# Altium schematic sheet BConditioner.SchDoc
size A4; SheetNumber: 4; SheetTotal: 5
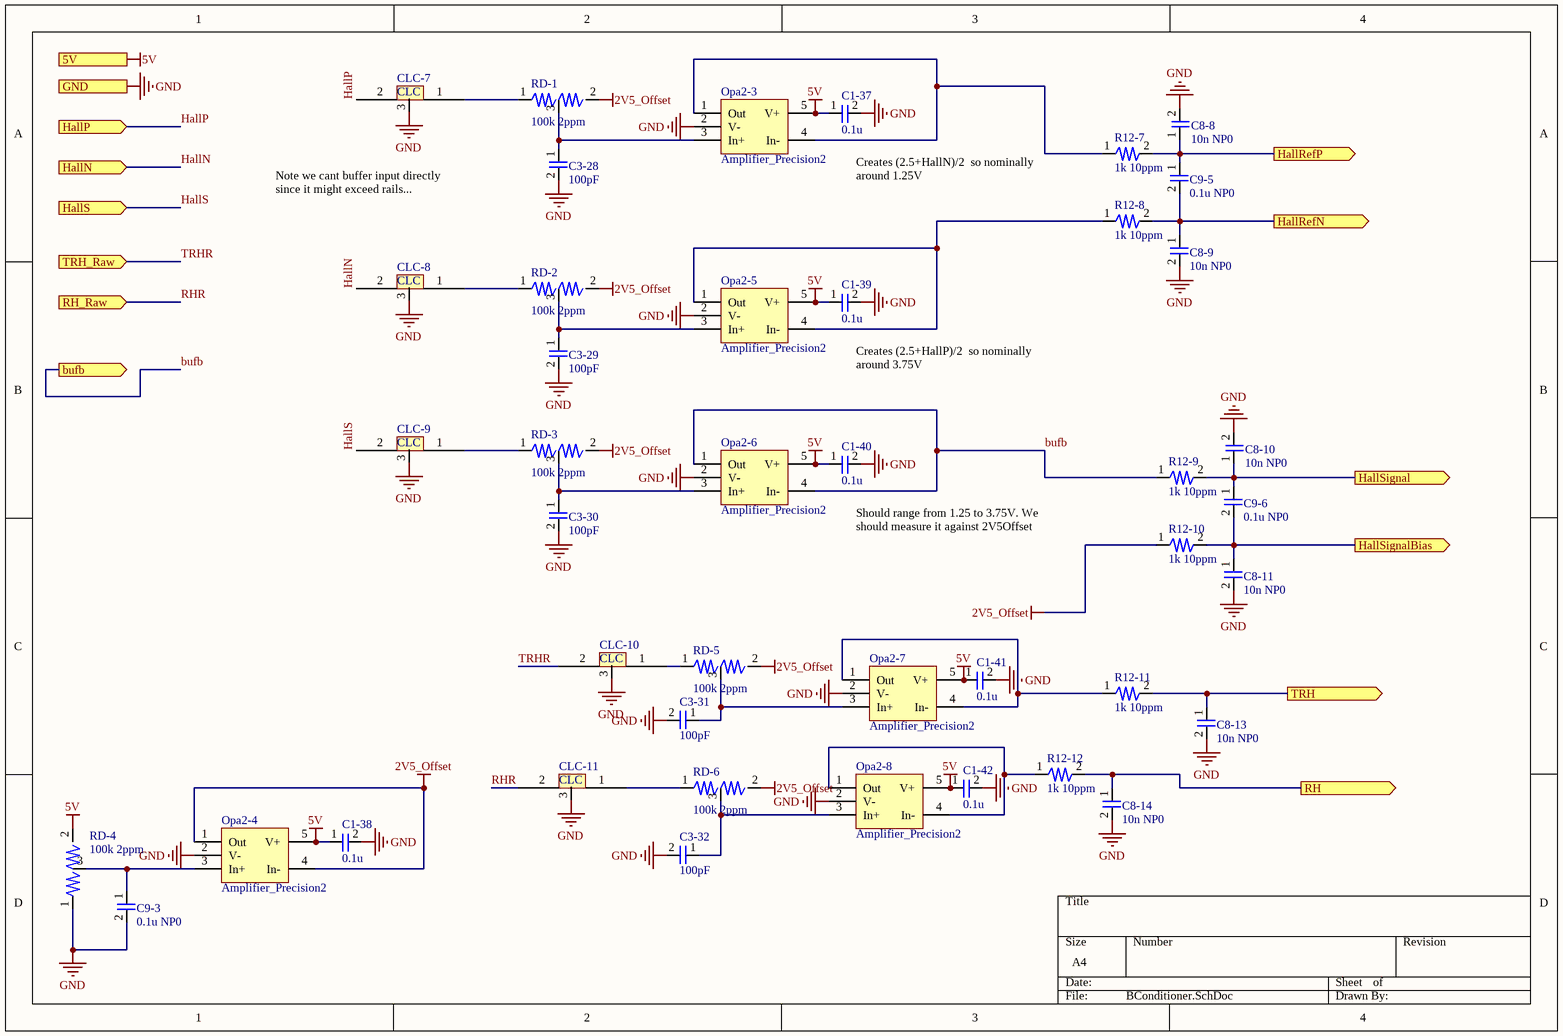
[diagram p0: BConditioner.SchDoc]

## Parts
C1-37  0.1u  [0805]
C1-38  0.1u  [0805]
C1-39  0.1u  [0805]
C1-40  0.1u  [0805]
C1-41  0.1u  [0805]
C1-42  0.1u  [0805]
C3-28  100pF  [0402]
C3-29  100pF  [0402]
C3-30  100pF  [0402]
C3-31  100pF  [0402]
C3-32  100pF  [0402]
C8-8  10n NP0  [0805]
C8-9  10n NP0  [0805]
C8-10  10n NP0  [0805]
C8-11  10n NP0  [0805]
C8-13  10n NP0  [0805]
C8-14  10n NP0  [0805]
C9-3  0.1u NP0  [1206]
C9-5  0.1u NP0  [1206]
C9-6  0.1u NP0  [1206]
CLC-7  CLC_Filter  [CRCFilter]  (value not drawn)
CLC-8  CLC_Filter  [CRCFilter]  (value not drawn)
CLC-9  CLC_Filter  [CRCFilter]  (value not drawn)
CLC-10  CLC_Filter  [CRCFilter]  (value not drawn)
CLC-11  CLC_Filter  [CRCFilter]  (value not drawn)
Opa2-3  Amplifier_Precision2  [SOT23-5]
Opa2-4  Amplifier_Precision2  [SOT23-5]
Opa2-5  Amplifier_Precision2  [SOT23-5]
Opa2-6  Amplifier_Precision2  [SOT23-5]
Opa2-7  Amplifier_Precision2  [SOT23-5]
Opa2-8  Amplifier_Precision2  [SOT23-5]
R12-7  1k 10ppm  [0805]
R12-8  1k 10ppm  [0805]
R12-9  1k 10ppm  [0805]
R12-10  1k 10ppm  [0805]
R12-11  1k 10ppm  [0805]
R12-12  1k 10ppm  [0805]
RD-1  100k 2ppm  [SOT23-3]
RD-2  100k 2ppm  [SOT23-3]
RD-3  100k 2ppm  [SOT23-3]
RD-4  100k 2ppm  [SOT23-3]
RD-5  100k 2ppm  [SOT23-3]
RD-6  100k 2ppm  [SOT23-3]

## Ports
5V (in), bufb (out), GND (in), HallN (in), HallP (in), HallRefN (out), HallRefP (out), HallS (in), HallSignal (out), HallSignalBias (out), RH (out), RH_Raw (in), TRH (out), TRH_Raw (in)

## Nets
2V5_Offset: Opa2-4.1(Out) Opa2-4.4(In-) R12-10.1 RD-1.2 RD-2.2 RD-3.2 RD-5.2 RD-6.2
5V: C1-37.1 C1-38.1 C1-39.1 C1-40.1 C1-41.1 C1-42.1 Opa2-3.5(V+) Opa2-4.5(V+) Opa2-5.5(V+) Opa2-6.5(V+) Opa2-7.5(V+) Opa2-8.5(V+) RD-4.2 ; port 5V
GND: C1-37.2 C1-38.2 C1-39.2 C1-40.2 C1-41.2 C1-42.2 C3-28.2 C3-29.2 C3-30.2 C3-31.2 C3-32.2 C8-8.2 C8-9.2 C8-10.2 C8-11.2 C8-13.2 C8-14.2 C9-3.2 CLC-7.3 CLC-8.3 CLC-9.3 CLC-10.3 CLC-11.3 Opa2-3.2(V-) Opa2-4.2(V-) Opa2-5.2(V-) Opa2-6.2(V-) Opa2-7.2(V-) Opa2-8.2(V-) RD-4.1 ; port GND
bufb: Opa2-6.1(Out) Opa2-6.4(In-) R12-9.1 ; port bufb
HallN: CLC-8.2 ; port HallN
HallP: CLC-7.2 ; port HallP
HallRefN: C8-9.1 C9-5.2 R12-8.2 ; port HallRefN
HallRefP: C8-8.1 C9-5.1 R12-7.2 ; port HallRefP
HallS: CLC-9.2 ; port HallS
HallSignal: C8-10.1 C9-6.1 R12-9.2 ; port HallSignal
HallSignalBias: C8-11.1 C9-6.2 R12-10.2 ; port HallSignalBias
RH: C8-14.1 R12-12.2 ; port RH
RHR: CLC-11.2 ; port RH_Raw
TRH: C8-13.1 R12-11.2 ; port TRH
TRHR: CLC-10.2 ; port TRH_Raw
NetC3-28_1: C3-28.1 Opa2-3.3(In+) RD-1.3
NetC3-29_1: C3-29.1 Opa2-5.3(In+) RD-2.3
NetC3-30_1: C3-30.1 Opa2-6.3(In+) RD-3.3
NetC3-31_1: C3-31.1 Opa2-7.3(In+) RD-5.3
NetC3-32_1: C3-32.1 Opa2-8.3(In+) RD-6.3
NetC9-3_1: C9-3.1 Opa2-4.3(In+) RD-4.3
NetCLC-7_1: CLC-7.1 RD-1.1
NetCLC-8_1: CLC-8.1 RD-2.1
NetCLC-9_1: CLC-9.1 RD-3.1
NetCLC-10_1: CLC-10.1 RD-5.1
NetCLC-11_1: CLC-11.1 RD-6.1
NetOpa2-3_1: Opa2-3.1(Out) Opa2-3.4(In-) R12-7.1
NetOpa2-5_1: Opa2-5.1(Out) Opa2-5.4(In-) R12-8.1
NetOpa2-7_1: Opa2-7.1(Out) Opa2-7.4(In-) R12-11.1
NetOpa2-8_1: Opa2-8.1(Out) Opa2-8.4(In-) R12-12.1

## Notes on the sheet
- Note we cant buffer input directly since it might exceed rails...
- (near C1-37) Creates (2.5+HallN)/2  so nominally around 1.25V
- (near C1-39) Creates (2.5+HallP)/2  so nominally around 3.75V
- (near C1-40) Should range from 1.25 to 3.75V. We should measure it against 2V5Offset
- (in symbol CLC_Filter) CLC

## Library data of the parts
C1-37-C1-42 C3-28-C3-32 C9-3 C9-5 C9-6 = Capacitor1
  C1-37-C1-42: Digikey P/N: 311-1140-1-ND
  C3-28-C3-32: Digikey P/N: 399-11246-1-ND
  C9-3 C9-5 C9-6: Digikey P/N: 490-GRT31C5C1H104FA02LCT-ND
C8-8-C8-11 C8-13 C8-14 = Capacitor1205: Digikey P/N: 490-1642-1-ND
R12-7-R12-12 = Res1: Digikey P/N: A140905CT-ND
RD-1-RD-6 = Res_Divider4: Digikey P/N: 764-MPMT2003AT5CT-ND
CLC-7-CLC-11 = CLC_Filter: Digikey P/N: 709-EMCF500W472M1GV001TCT-ND, 240-2559-1-ND
Opa2-3-Opa2-8 = Amplifier_Precision2: Digikey P/N: 296-OPA388QDBVRQ1CT-ND